# Altium schematic sheet Power-Sheet-1.SchDoc
size A4; SheetNumber: 2; SheetTotal: 7
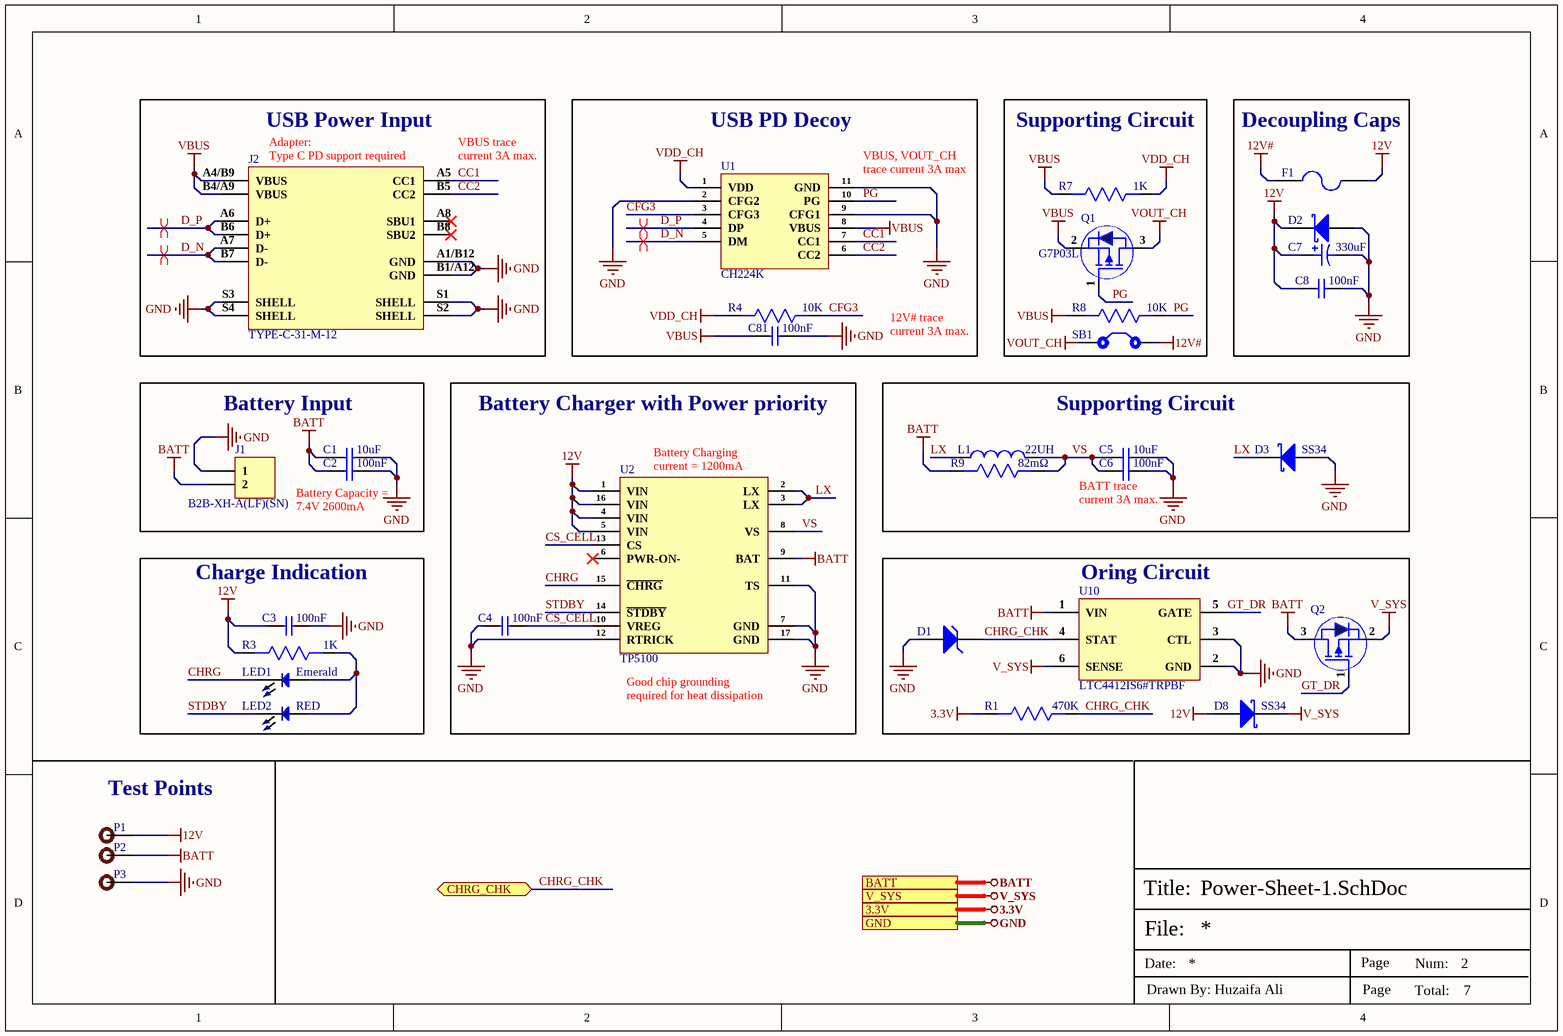
[diagram p0: Power-Sheet-1.SchDoc]

## Parts
C1  10uF  [Cap-0805]
C2  100nF  [Cap-0402]
C3  100nF  [Cap-0402]
C4  100nF  [Cap-0402]
C5  10uF  [Cap-0805]
C6  100nF  [Cap-0402]
C7  330uF  [25SVPF330M]
C8  100nF  [Cap-0402]
C81  100nF  [Cap-0402]
D1  MM3Z3V3B  [SOD323F]  (value not drawn)
D2  PESD12VS1UA,115  [SOD-323]  (value not drawn)
D3  SS34  [SMA]
D8  SS34  [SMA]
F1  BSMD1812-260-13.2V  [1812-FUSE]  (value not drawn)
J1  B2B-XH-A(LF)(SN)  [B2B-XH-A(LF)(SN)_]
J2  TYPE-C-31-M-12  [TYPE-C-31-M-12_]
L1  22UH  [YPRH1204-220M_]
LED1  Emerald  [LED-0603]
LED2  RED  [LED-0603]
P1  TEST POINT  [Test-point]  (value not drawn)
P2  TEST POINT  [Test-point]  (value not drawn)
P3  TEST POINT  [Test-point]  (value not drawn)
Q1  G7P03L  [SOT-23-3L_]
Q2  AO3407  [SOT-23]  (value not drawn)
R1  470K  [RES-0603]
R3  1K  [Res-0603]
R4  10K  [Res-0603]
R7  1K  [Res-0603]
R8  10K  [Res-0603]
R9  82mΩ  [RES-0805]
SB1  Solder Bridge 0402  [Solder Bridge 0402]  (value not drawn)
U1  CH224K  [ESSOP-10]
U2  TP5100  [TQFN-16-EP(4x4)_]
U10  LTC4412IS6#TRPBF  [SOT-23-6]

## Blocks framed on the sheet
USB Power Input: J2
USB PD Decoy: C81 R4 U1
Supporting Circuit: Q1 R7 R8 SB1
Decoupling Caps: C7 C8 D2 F1
Battery Input: C1 C2 J1
Battery Charger with Power priority: C4 U2
Supporting Circuit: C5 C6 D3 L1 R9
Charge Indication: C3 LED1 LED2 R3
Oring Circuit: D1 D8 Q2 R1 U10

## Ports
3.3V, BATT, CHRG_CHK (bidir), GND, V_SYS

## Nets
3.3V: R1.2 ; port 3.3V
12V: C3.1 C7.1 C8.1 D2.1(K) D8.2(A) F1.2 P1.1 R3.2 U2.1(VIN) U2.4(VIN) U2.5(VIN) U2.16(VIN)
12V#: F1.1 SB1.2
BATT: C1.1 C2.1 J1.2 P2.1 Q2.3(D) R9.2 U2.9(BAT) U10.1(VIN) ; port BATT
GND: C1.2 C2.2 C3.2 C4.1 C5.2 C6.2 C7.2 C8.2 C81.2 D1.1(A) D2.2(A) D3.2(A) J1.1 J2.A1/B12(GND) J2.B1/A12(GND) J2.S1(SHELL) J2.S2(SHELL) J2.S3(SHELL) J2.S4(SHELL) P3.1 U1.2(CFG2) U1.9(CFG1) U1.11(GND) U2.7(GND) U2.11(TS) U2.12(RTRICK) U2.17(GND) U10.2(GND) U10.3(CTL) ; port GND
V_SYS: D8.1(K) Q2.2(S) U10.6(SENSE) ; port V_SYS
VBUS: C81.1 J2.A4/B9(VBUS) J2.B4/A9(VBUS) Q1.2(S) R7.2 R8.2 U1.8(VBUS)
VDD_CH: R4.2 R7.1 U1.1(VDD)
VOUT_CH: Q1.3(D) SB1.1
CC1: J2.A5(CC1) U1.7(CC1)
CC2: J2.B5(CC2) U1.6(CC2)
CFG3: R4.1 U1.3(CFG3)
CHRG: LED1.2 U2.15(~{CHRG})
CHRG_CHK: D1.2(K) R1.1 U10.4(STAT) ; port CHRG_CHK
CS_CELL: C4.2 U2.10(VREG) U2.13(CS)
D_N: J2.A7(D-) J2.B7(D-) U1.5(DM)
D_P: J2.A6(D+) J2.B6(D+) U1.4(DP)
GT_DR: Q2.1(G) U10.5(GATE)
LX: D3.1(K) L1.1 U2.2(LX) U2.3(LX)
PG: Q1.1(G) R8.1 U1.10(PG)
STDBY: LED2.2 U2.14(~{STDBY})
VS: C5.1 C6.1 L1.2 R9.1 U2.8(VS)
NetLED1_1: LED1.1 LED2.1 R3.1

Not connected (* = marked no-connect by the designer): J2 A8(SBU1)* B8(SBU2)*; U2 6(PWR-ON-)*

## Layout directives
differential pair; differential pair class USB_Lines; net class USB; rule Matched Net Lengths [Tolerance = 50mil]; rule Impedance Constraint [Min = 85.00    Max = 90.00    ]: D_N, D_P

## Notes on the sheet
- (near J2) Adapter:
  Type C PD support required
- (near J2) VBUS trace current 3A max.
- (near U1) VBUS, VOUT_CH trace current 3A max
- 12V# trace current 3A max.
- (near C2) Battery Capacity = 7.4V 2600mA
- (near U2) Battery Charging current = 1200mA
- (near C6) BATT trace current 3A max.
- (near U2) Good chip grounding required for heat dissipation
- Test Points
- File:
- Title:
- Date:
- Page
- Num:
- Total:
- Drawn By: Huzaifa Ali

## Library data of the parts
C1 C5 = CC0805KKX5R8BB106: CAP CER 10UF 25V X5R 0805; Manufacturer: Yageo; Tolerance: 10%; Supplier 1: Digi-Key; Manufacturer Part Number: CC0805KKX5R8BB106; RoHS: Yes; Category: Ceramic Capacitors; Stock 1: 554290; Pricing 1: 1=0.31000, 10=0.21200, 50=0.14820, 100=0.12710, 500=0.09534, 1000=0.08050 (USD); Mount: Surface Mount; Case/Package: 0805; Case Code (Imperial): 0805; Case Code (Metric): 2012; Weight: 0.000194oz; Min Operating Temperature: -55°C; Max Operating Temperature: 85°C; Capacitance: 10uF; Voltage Rating (DC): 25V; Packaging: Tape and Reel; Voltage Rating: 25V; Dielectric: X5R; Termination: SMD/SMT; Resistor Type: Ceramic; Series: CC; Length: 0.079inch; Width: 0.049inch; Thickness: 0.057inch; Depth: 1.25mm; Lead Free: Lead Free; Halogen Free: Halogen Free; RoHS Compliant: Yes; ComponentLink1URL: http://www.mouser.com/ds/2/447/UPY-GPHC_X5R_4V-to-50V_25-1131599.pdf?src-supplier=Mouser; ComponentLink1Description: http://www.mouser.com/ds/2/447/UPY-GPHC_X5R_4V-to-50V_25-1131599.pdf?src-supplier=Mouser; ComponentLink2URL: http://www.yageo.com/documents/recent/UPY-GPHC_X5R_4V-to-50V_25.pdf?src-supplier=Digi-Key; ComponentLink2Description: http://www.yageo.com/documents/recent/UPY-GPHC_X5R_4V-to-50V_25.pdf?src-supplier=Digi-Key; Supplier Part Number 1: 311-1869-1-ND; LCSC Part Number: C89831
C2-C4 C6 C8 C81 = CC0402KRX5R8BB104: CAP CER 0.1UF 25V X5R 0402; Manufacturer: Yageo; Tolerance: 10%; Item Type: Capacitor; Supplier 1: Digi-Key; Manufacturer Part Number: CC0402KRX5R8BB104; RoHS: Yes; Category: Ceramic Capacitors; Stock 1: 4598218; Pricing 1: 1=0.10000, 10=0.03800, 50=0.02100, 100=0.01710, 500=0.01224, 1000=0.00961, 2500=0.00874, 5000=0.00804 (USD); Mount: Surface Mount; Case/Package: 0402; Case Code (Metric): 1005; Case Code (Imperial): 0402; Min Operating Temperature: -55°C; Max Operating Temperature: 85°C; Voltage Rating: 25V; Packaging: Tape and Reel; Capacitance: 100nF; Voltage Rating (DC): 25V; Dielectric: X5R; Resistor Type: Ceramic; Series: CC; Length: 0.039inch; Width: 0.02inch; Thickness: 0.022inch; Depth: 0.5mm; Lead Free: Lead Free; Halogen Free: Halogen Free; RoHS Compliant: Yes; ComponentLink1URL: http://www.mouser.com/ds/2/447/UPY-GPHC_X5R_4V-to-50V_25-1131599.pdf?src-supplier=Mouser; ComponentLink1Description: http://www.mouser.com/ds/2/447/UPY-GPHC_X5R_4V-to-50V_25-1131599.pdf?src-supplier=Mouser; ComponentLink2URL: http://www.yageo.com/documents/recent/UPY-GPHC_X5R_4V-to-50V-16.pdf?src-supplier=Future+Electronics; ComponentLink2Description: http://www.yageo.com/documents/recent/UPY-GPHC_X5R_4V-to-50V-16.pdf?src-supplier=Future+Electronics; ComponentLink3URL: http://www.yageo.com/documents/recent/UPY-GPHC_X5R_4V-to-50V_25.pdf?src-supplier=Digi-Key; ComponentLink3Description: http://www.yageo.com/documents/recent/UPY-GPHC_X5R_4V-to-50V_25.pdf?src-supplier=Digi-Key; Supplier Part Number 1: 311-1697-1-ND; LCSC Part Number: C106256
C7 = 25SVPF330M: CAP ALUM POLY 330UF 20% 25V SMD; Manufacturer: Panasonic; Ripple Current: 5A; Life (Hours): 5000Hour; ESR (Equivalent Series Resistance): 14mR; Polarity: Polar; Leakage Current: 1.65mA; Dissipation Factor: 12%; Item Type: Capacitor; Supplier 1: Avnet; Manufacturer Part Number: 25SVPF330M; RoHS: Yes; Category: Polymer Capacitors; Stock 1: 680; Pricing 1: 1=2.46000, 10=2.01000, 25=1.86000, 50=1.72000, 100=1.57000, 250=1.54000 (USD); Mount: Surface Mount; Case/Package: Radial; Number of Pins: 12; Min Operating Temperature: -55°C; Max Operating Temperature: 105°C; Tolerance: 20%; Packaging: Tape and Reel; Package Quantity: 400; Capacitance: 330uF; Voltage Rating: 25V; Voltage Rating (DC): 25V; Termination: SMD/SMT; Voltage: 25V; Series: OS-CON™, SVPF; Construction: Cylindrical; Ripple Current (AC): 5A; Diameter: 10mm; Length: 12.6mm; Height: 12.6mm; Height - Seated (Max): 0.5inch; Reach SVHC Compliant: Yes; Lead Free: Lead Free; RoHS Compliant: Yes; ComponentLink1URL: https://datasheet.ciiva.com/48542/svpf-eng-ds-48542398.pdf?src-supplier=Distrelec; ComponentLink1Description: https://datasheet.ciiva.com/48542/svpf-eng-ds-48542398.pdf?src-supplier=Distrelec; ComponentLink2URL: https://datasheet.ciiva.com/22746/1734360-22746217.pdf?src-supplier=Element14; ComponentLink2Description: https://datasheet.ciiva.com/22746/1734360-22746217.pdf?src-supplier=Element14; ComponentLink3URL: https://datasheet.ciiva.com/24216/svpf-os-262415-24216060.pdf?src-supplier=Mouser; ComponentLink3Description: https://datasheet.ciiva.com/24216/svpf-os-262415-24216060.pdf?src-supplier=Mouser; ComponentLink4URL: https://datasheet.ciiva.com/46650/70324301-46650266.pdf?src-supplier=Allied+Electronics; ComponentLink4Description: https://datasheet.ciiva.com/46650/70324301-46650266.pdf?src-supplier=Allied+Electronics; Supplier Part Number 1: 68AC5716; LCSC Part Number: C178367
D1 = MM3Z3V3B: DIODE ZENER 3.3V 200MW SOD323F; Manufacturer: ON Semiconductor / Fairchild; Forward Voltage: 1V; Tolerance: 2%; Impedance: 89R; Max Reverse Leakage Current: 4.5uA; Test Current: 5mA; Element Configuration: Single; Supplier 1: Digi-Key; Manufacturer Part Number: MM3Z3V3B; Stock 1: 473644; Pricing 1: 1=0.22, 10=0.18, 100=0.0956, 500=0.06288, 1000=0.04276 (USD); Mount: Surface Mount; Number of Pins: 2; Weight: 0.0276g; Min Operating Temperature: -65°C; Max Operating Temperature: 150°C; Packaging: Tape and Reel; Package Quantity: 1; Max Power Dissipation: 200mW; Zener Voltage: 3.3V; Voltage Tolerance: 2%; Power Dissipation: 200mW; Working Voltage: 3.3V; Peak Reverse Current: 4.5uA; Length: 1.3mm; Height: 1mm; Width: 1.7mm; Radiation Hardening: No; REACH SVHC: No SVHC; Lead Free: Lead Free; ComponentLink1URL: http://www.onsemi.com/pub/Collateral/MM3Z9V1B-D.pdf?src-supplier=Digi-Key; ComponentLink1Description: http://www.onsemi.com/pub/Collateral/MM3Z9V1B-D.pdf?src-supplier=Digi-Key; ComponentLink2URL: http://www.mouser.com/ds/2/149/MM3Z3V3B-187166.pdf?src-supplier=Mouser; ComponentLink2Description: http://www.mouser.com/ds/2/149/MM3Z3V3B-187166.pdf?src-supplier=Mouser; ComponentLink3URL: https://www.fairchildsemi.com/datasheets/MM/MM3Z9V1B.pdf?src-supplier=Avnet; ComponentLink3Description: https://www.fairchildsemi.com/datasheets/MM/MM3Z9V1B.pdf?src-supplier=Avnet; ComponentLink4URL: http://www.farnell.com/datasheets/1706525.pdf?src-supplier=Element14; ComponentLink4Description: http://www.farnell.com/datasheets/1706525.pdf?src-supplier=Element14; Supplier Part Number 1: MM3Z3V3BCT-ND; LCSC Part Number: C2978865
D2 = PESD12VS1UA,115: TVS DIODE 12VWM 27VC SOD323; Manufacturer: Nexperia; Supplier 1: Mouser; Manufacturer Part Number: PESD12VS1UA,115; RoHS: Yes; Category: ESD and Circuit Protection ICs; Stock 1: 44616; Pricing 1: 1=0.47000, 10=0.34800, 50=0.34800, 100=0.19600, 1000=0.10300, 10000=0.07400 (USD); RoHS Compliant: Yes; ComponentLink1URL: http://www.farnell.com/datasheets/1508356.pdf?src-supplier=Farnell; ComponentLink1Description: http://www.farnell.com/datasheets/1508356.pdf?src-supplier=Farnell; Supplier Part Number 1: 771-PESD12S1UA115; LCSC Part Number: C131084; Item Type: TVS Diode
D3 D8 = SS34: 0.5mA@40V 40V Single 3A 0.55V@3A SMA(DO-214AC) Schottky Barrier Diodes (SBD) ROHS; Manufacturer: MDD; Item Type: Diode; Manufacturer Part Number: SS34; Package: SMA(DO-214AC); LCSC Part Number: C8678; ComponentLink1Description: LCSC; ComponentLink1URL: https://www.lcsc.com/product-detail/Schottky-Barrier-Diodes-SBD_MDD-Microdiode-Electronics-SS34_C8678.html
F1 = BSMD1812-260-13.2V: 13.2V 2.6A 40A 800mW -40℃~+85℃ 5.2A 10mΩ 2.5s 50mΩ 1812 Resettable Fuses ROHS; Manufacturer: BHFUSE; Item: 1812; Item Type: Fuse; Amps: 2.6A-40A; Manufacturer Part Number: BSMD1812-260-13.2V; LCSC Part Number: C883159; Volts: 13.2V; Watt: 800mW; ComponentLink1Description: LCSC; ComponentLink1URL: https://www.lcsc.com/product-detail/Resettable-Fuses_BHFUSE-BSMD1812-260-13-2V_C883159.html
J1 = B2B-XH-A(LF)(SN): Conn Shrouded Header (4 Sides) HDR 2 POS 2.5mm Solder ST Thru-Hole Box; Manufacturer: JST; Number of Positions: 2; Connector Type: Male Pin; Current Rating: 3A; Contact Resistance: 20mR; Voltage Rating: 250V; Insulation Resistance: 1GR; Wire/Cable Gauge: 22AWG; Item Type: JST Connector; Supplier 1: Farnell; Manufacturer Part Number: B2B-XH-A(LF)(SN); RoHS: Yes; Category: FFC / FPC; Stock 1: 219240; Pricing 1: 100=0.06860, 1000=0.04800, 2500=0.04520, 5000=0.04230, 10000=0.03950, 20000=0.03660 (GBP); Mount: Through Hole; Contact Plating: Tin,Copper,Lead; Color: Natural; Contact Material: Brass; Housing Color: White; Housing Material: Polyamide; Min Operating Temperature: -25°C; Max Operating Temperature: 85°C; Number of Rows: 1; Packaging: Bulk; Termination: Solder; Fastening Type: Detent; Max Current Rating: 3A; Voltage Rating (AC): 250V; Max Voltage Rating (AC): 250V; Number of Contacts: 2; Max Voltage Rating (DC): 250V; Orientation: Straight; Length: 7.4mm; Pitch: 2.5mm; Lead Pitch: 2.5mm; Depth: 5.75mm; REACH SVHC: No SVHC; Lead Free: Lead Free; ComponentLink1URL: https://datasheet.ciiva.com/26894/getdatasheetpartid-640357-26894434.pdf?src-supplier=Verical; ComponentLink1Description: https://datasheet.ciiva.com/26894/getdatasheetpartid-640357-26894434.pdf?src-supplier=Verical; ComponentLink2URL: https://datasheet.ciiva.com/11746/0900766b8082653e-11746979.pdf?src-supplier=RSComponents; ComponentLink2Description: https://datasheet.ciiva.com/11746/0900766b8082653e-11746979.pdf?src-supplier=RSComponents; ComponentLink3URL: https://datasheet.ciiva.com/26894/getdatasheetpartid-385291-26894760.pdf?src-supplier=Verical; ComponentLink3Description: https://datasheet.ciiva.com/26894/getdatasheetpartid-385291-26894760.pdf?src-supplier=Verical; ComponentLink4URL: https://datasheet.ciiva.com/8052/5448-8052024.pdf?src-supplier=Element14; ComponentLink4Description: https://datasheet.ciiva.com/8052/5448-8052024.pdf?src-supplier=Element14; ComponentLink5URL: https://datasheet.ciiva.com/20207/523653-20207167.pdf?src-supplier=Rapid+Electronics; ComponentLink5Description: https://datasheet.ciiva.com/20207/523653-20207167.pdf?src-supplier=Rapid+Electronics; Supplier Part Number 1: 1516276; LCSC Part Number: C158012
J2 = TYPE-C-31-M-12: 250mA 1 16 Female Type-C SMD USB Connectors ROHS; Manufacturer: Korean Hroparts Elec; ComponentLink1Description: LCSC; ComponentLink1URL: https://www.lcsc.com/product-detail/USB-Connectors_Korean-Hroparts-Elec-TYPE-C-31-M-12_C165948.html; Manufacturer Part Number: TYPE-C-31-M-12; Footprint: Custom; LCSC Part Number: C165948; Item Type: USB Connector
L1 = YPRH1204-220M: 2.9A 22uH ±20% 66mΩ SMD,12x12x5mm Power Inductors ROHS; Manufacturer: YJYCOIN; Manufacturer Part Number: YPRH1204-220M; Package: SMD,12x12x5mm; LCSC Part Number: C338845; Item Type: Inductor; ComponentLink1Description: LCSC; ComponentLink1URL: https://www.lcsc.com/product-detail/Power-Inductors_YJYCOIN-YPRH1204-220M_C338845.html
LED1 = NCD0603G2: Emerald 0603 Light Emitting Diodes (LED) ROHS; Manufacturer: Foshan NationStar Optoelectronics; Manufacturer Part Number: NCD0603G2; Package: 0603; LCSC Part Number: C87326; Item Type: LED; ComponentLink1Description: LCSC; ComponentLink1URL: https://www.lcsc.com/product-detail/Light-Emitting-Diodes-LED_Foshan-NationStar-Optoelectronics-NCD0603G2_C87326.html
LED2 = NCD0603R3: 0603 Light Emitting Diodes (LED) ROHS; Manufacturer: Foshan NationStar Optoelectronics; Manufacturer Part Number: NCD0603R3; Package: 0603; Item Type: LED; LCSC Part Number: C3151730; ComponentLink1Description: LCSC; ComponentLink1URL: https://www.lcsc.com/product-detail/Light-Emitting-Diodes-LED_Foshan-NationStar-Optoelectronics-NCD0603R3_C3151730.html
P1-P3 = TEST POINT: Test Point ON; Item Type: TEST POINT
Q1 = G7P03L: 30V 7A 19mΩ 1.9W 1.1V@250uA P Channel SOT-23-3L MOSFETs ROHS; Manufacturer: GoFord; Item Type: Mosfet; Supplier 1: Digi-Key; Manufacturer Part Number: G7P03L; RoHS: No; Category: Uncategorized; Stock 1: 6672; Pricing 1: 1=0.45000, 10=0.36500, 100=0.24860, 500=0.18648, 1000=0.13986 (USD); LCSC Part Number: C840062; ComponentLink1Description: LCSC; ComponentLink1URL: https://www.lcsc.com/product-detail/MOSFETs_GOFORD-G7P03L_C840062.html
Q2 = AO3407: 30V 4.1A 60mΩ@10V,4.1A 350mW 3V@250uA P Channel SOT-23 MOSFETs ROHS; Manufacturer: Guangdong Hottech; Item Type: Mosfet; Manufacturer Part Number: AO3407; Package: SOT-23; LCSC Part Number: C181093; ComponentLink1Description: LCSC; ComponentLink1URL: https://www.lcsc.com/product-detail/MOSFETs_Guangdong-Hottech-AO3407_C181093.html
R1 = AC0603JR-07470KL: RES SMD 470K OHM 5% 1/10W 0603; Manufacturer: Yageo; Resistance: 470kR; Power Rating: 100mW; Voltage Rating: 50V; Temperature Coefficient: 100ppm/°C; Item Type: Resistor; ComponentLink1URL: https://datasheet.ciiva.com/11820/0900766b80808d64-11820639.pdf?src-supplier=RSComponents; ComponentLink1Description: https://datasheet.ciiva.com/11820/0900766b80808d64-11820639.pdf?src-supplier=RSComponents; ComponentLink2URL: https://datasheet.ciiva.com/2487/rr-data-sheet-2487286.pdf?src-supplier=Digi-Key; ComponentLink2Description: https://datasheet.ciiva.com/2487/rr-data-sheet-2487286.pdf?src-supplier=Digi-Key; ComponentLink3URL: https://datasheet.ciiva.com/7984/87330-7984374.pdf?src-supplier=Element14; ComponentLink3Description: https://datasheet.ciiva.com/7984/87330-7984374.pdf?src-supplier=Element14; ComponentLink4URL: https://datasheet.ciiva.com/2487/rr-data-sheet-2487287.pdf?src-supplier=Digi-Key; ComponentLink4Description: https://datasheet.ciiva.com/2487/rr-data-sheet-2487287.pdf?src-supplier=Digi-Key; ComponentLink5URL: https://datasheet.ciiva.com/2487/rr-data-sheet-2487288.pdf?src-supplier=Digi-Key; ComponentLink5Description: https://datasheet.ciiva.com/2487/rr-data-sheet-2487288.pdf?src-supplier=Digi-Key; ComponentLink6URL: https://datasheet.ciiva.com/5759/87330-5759049.pdf?src-supplier=Farnell; ComponentLink6Description: https://datasheet.ciiva.com/5759/87330-5759049.pdf?src-supplier=Farnell; Supplier 1: Digi-Key; Manufacturer Part Number: AC0603JR-07470KL; Stock 1: 71; Pricing 1: 1=0.1, 10=0.024, 100=0.0097, 1000=0.0044, 2500=0.0038 (USD); Case/Package: 0603; Case Code (Imperial): 0603; Case Code (Metric): 1608; Weight: 7.1E-05oz; Min Operating Temperature: -55°C; Max Operating Temperature: 155°C; Tolerance: 5%; Packaging: Tape and Reel; Resistor Type: Thick Film; Termination: SMD/SMT; Number of Terminations: 2; Max Power Dissipation: 100mW; Features: Moisture Resistant,Automotive AEC-Q200; Series: AC; Length: 0.063inch; Width: 0.8mm; Height: 0.022inch; RoHS Compliant: Yes; ComponentLink7URL: http://www.mouser.com/ds/2/447/yageodocoutput-1111992.pdf?src-supplier=Mouser; ComponentLink7Description: http://www.mouser.com/ds/2/447/yageodocoutput-1111992.pdf?src-supplier=Mouser; Supplier Part Number 1: YAG3672DKR-ND; LCSC Part Number: C144601
R3 R7 = RC0603FR-071KL: RES SMD 1K OHM 1% 1/10W 0603; Manufacturer: Yageo; Resistance: 1kR; Temperature Coefficient: 100ppm/°C; Power Rating: 100mW; Voltage Rating: 50V; Item type: Resistor; ComponentLink1URL: https://www.verical.com/server-webapp/html/getDatasheet?partID=409289&src-supplier=Verical; ComponentLink1Description: https://www.verical.com/server-webapp/html/getDatasheet?partID=409289&src-supplier=Verical; Supplier 1: Digi-Key; Manufacturer Part Number: RC0603FR-071KL; Stock 1: 21472395; Pricing 1: 1=0.1, 10=0.023, 100=0.0094, 1000=0.0042, 2500=0.0037 (USD); Case/Package: 0603; Contact Plating: Tin,Matte; Case Code (Imperial): 0603; Case Code (Metric): 1608; Min Operating Temperature: -55°C; Max Operating Temperature: 155°C; Tolerance: 1%; Composition: Thick Film; Packaging: Tape and Reel; Termination: SMD/SMT; Military Standard: Not; Length: 1.6mm; Height: 0.45mm; Depth: 0.8mm; Radiation Hardening: No; REACH SVHC: No SVHC; Lead Free: Lead Free; ComponentLink2URL: http://documents.rs-components.com/techlib://itc_doclist_GB.htm?stockno=5048928&src-supplier=RSComponents; ComponentLink2Description: http://documents.rs-components.com/techlib://itc_doclist_GB.htm?stockno=5048928&src-supplier=RSComponents; ComponentLink3URL: http://www.yageo.com/documents/recent/PYu-RC0603_51_RoHS_L_4.pdf?src-supplier=Avnet+Europe; ComponentLink3Description: http://www.yageo.com/documents/recent/PYu-RC0603_51_RoHS_L_4.pdf?src-supplier=Avnet+Europe; ComponentLink4URL: http://www.farnell.com/datasheets/2167052.pdf?src-supplier=Element14; ComponentLink4Description: http://www.farnell.com/datasheets/2167052.pdf?src-supplier=Element14; ComponentLink5URL: http://www.farnell.com/datasheets/1868787.pdf?src-supplier=Element14; ComponentLink5Description: http://www.farnell.com/datasheets/1868787.pdf?src-supplier=Element14; ComponentLink6URL: http://www.yageo.com/documents/recent/PYu-RC_Group_51_RoHS_L_2.pdf?src-supplier=Avnet; ComponentLink6Description: http://www.yageo.com/documents/recent/PYu-RC_Group_51_RoHS_L_2.pdf?src-supplier=Avnet; ComponentLink7URL: https://www.verical.com/server-webapp/html/getDatasheet?partID=404327&src-supplier=Verical; ComponentLink7Description: https://www.verical.com/server-webapp/html/getDatasheet?partID=404327&src-supplier=Verical; ComponentLink8URL: http://www.farnell.com/datasheets/443971.pdf?src-supplier=Element14; ComponentLink8Description: http://www.farnell.com/datasheets/443971.pdf?src-supplier=Element14; Supplier Part Number 1: 311-1.00KHRDKR-ND; LCSC Part Number: C22548
R4 R8 = RC0603FR-0710KL: RES SMD 10K Ohm 1% 1/10W 0603; Manufacturer: Yageo; Resistance: 10kR; Temperature Coefficient: 100ppm/°C; Voltage Rating (DC): 50V; Power Rating: 100mW; Voltage Rating: 75V; Item Type: Resistor; Supplier 1: Digi-Key; Manufacturer Part Number: RC0603FR-0710KL; RoHS: Yes; Category: Chip SMD Resistors; Stock 1: 25249139; Pricing 1: 1=0.10000, 10=0.02400, 100=0.00970, 1000=0.00436, 2500=0.00378 (USD); Case/Package: 0603; Number of Pins: 2; Case Code (Imperial): 0603; Case Code (Metric): 1608; Weight: 7.1E-05oz; Size Code: 0603; Min Operating Temperature: -55°C; Max Operating Temperature: 155°C; Tolerance: 1%; Resistor Type: Thick Film; Packaging: Tape and Reel; Termination: SMD/SMT; Features: Moisture Resistant; Series: RC; Max Power Dissipation: 100mW; Number of Terminations: 2; Resistance Tolerance: 1%; Construction: Rectangular; Length: 1.6mm; Width: 0.8mm; Height: 0.45mm; Depth: 0.8mm; Lead Pitch: 0.3mm; REACH SVHC: Unknown; Lead Free: Lead Free; Military Standard: Not; RoHS Compliant: Yes; ComponentLink1URL: https://datasheet.ciiva.com/7660/38590-7660789.pdf?src-supplier=Element14; ComponentLink1Description: https://datasheet.ciiva.com/7660/38590-7660789.pdf?src-supplier=Element14; ComponentLink2URL: https://datasheet.ciiva.com/7983/443971-7983596.pdf?src-supplier=Element14; ComponentLink2Description: https://datasheet.ciiva.com/7983/443971-7983596.pdf?src-supplier=Element14; ComponentLink3URL: https://datasheet.ciiva.com/22747/443971-22747519.pdf?src-supplier=Element14; ComponentLink3Description: https://datasheet.ciiva.com/22747/443971-22747519.pdf?src-supplier=Element14; ComponentLink4URL: https://datasheet.ciiva.com/46440/1868787-46440891.pdf?src-supplier=Element14; ComponentLink4Description: https://datasheet.ciiva.com/46440/1868787-46440891.pdf?src-supplier=Element14; ComponentLink5URL: https://datasheet.ciiva.com/7746/1738695-7746239.pdf?src-supplier=Element14; ComponentLink5Description: https://datasheet.ciiva.com/7746/1738695-7746239.pdf?src-supplier=Element14; ComponentLink6URL: https://datasheet.ciiva.com/15189/getdatasheetpartid-409289-15189591.pdf?src-supplier=Verical; ComponentLink6Description: https://datasheet.ciiva.com/15189/getdatasheetpartid-409289-15189591.pdf?src-supplier=Verical; Supplier Part Number 1: 311-10.0KHRCT-ND; LCSC Part Number: C98220
R9 = 0805W4J082LT5E: 250mW Thick Film Resistors 150V ±5% ±800ppm/℃ -55℃~+155℃ 82mΩ 0805 Chip Resistor - Surface Mount ROHS; Manufacturer: UNI-ROYAL(Uniroyal Elec); Manufacturer Part Number: 0805W4J082LT5E; Package: 0805; LCSC Part Number: C2767643; Item Type: Resistor; ComponentLink1Description: LCSC; ComponentLink1URL: https://www.lcsc.com/product-detail/Chip-Resistor-Surface-Mount_UNI-ROYAL-Uniroyal-Elec-0805W4J082LT5E_C2767643.html; Value: 82mΩ
SB1 = Solder Bridge 0402: Solder Bridge ON; Manufacturer Part Number: Solder Bridge 0402; Item Type: Solder Bridge
U1 = CH224K: USB充电芯片 ESSOP-10 USB ICs ROHS; Manufacturer: WCH(Jiangsu Qin Heng); Item Type: IC; Manufacturer Part Number: CH224K; Package: ESSOP-10; LCSC Part Number: C970725; ComponentLink1Description: LCSC; ComponentLink1URL: https://www.lcsc.com/product-detail/USB-ICs_WCH-Jiangsu-Qin-Heng-CH224K_C970725.html
U2 = TP5100: TQFN-16-EP(4x4) Battery Management ICs ROHS; Manufacturer: TOPPOWER(Nanjing Extension Microelectronics); Item Type: IC; Manufacturer Part Number: TP5100; Package: TQFN-16-EP(4x4); LCSC Part Number: C379389; ComponentLink1Description: LCSC; ComponentLink1URL: https://www.lcsc.com/product-detail/Battery-Management-ICs_TOPPOWER-Nanjing-Extension-Microelectronics-TP5100_C379389.html
U10 = LTC4412IS6#TRPBF: IC OR CTRLR SRC SELECT TSOT23-6; Manufacturer: Analog Devices / Linear Technology; Turn-On Delay Time: 110us; Turn-Off Delay Time: 13us; Operating Supply Current: 15uA; Supplier 1: Digi-Key; Manufacturer Part Number: LTC4412IS6#TRPBF; RoHS: Yes; Category: Uncategorized; Stock 1: 2608; Pricing 1: 1=3.90000, 10=3.50700, 25=3.31520, 100=2.87310, 250=2.72580, 500=2.44584, 1000=2.08500 (USD); Case/Package: SOT-23-6; Number of Pins: 6; Min Operating Temperature: -40°C; Max Operating Temperature: 85°C; Package Quantity: 2500; Packaging: Tape and Reel; Series: PowerPath™; Length: 2.9mm; RoHS Compliant: Yes; ComponentLink1URL: https://datasheet.ciiva.com/1960/1527-1960891.pdf?src-supplier=Digi-Key; ComponentLink1Description: https://datasheet.ciiva.com/1960/1527-1960891.pdf?src-supplier=Digi-Key; Supplier Part Number 1: LTC4412IS6#TRPBFCT-ND; LCSC Part Number: C521306; Item Type: IC